# EasyEDA Pro project PLOTUS_ESP32S3_revA_project.epro

# Schematic Schematic1
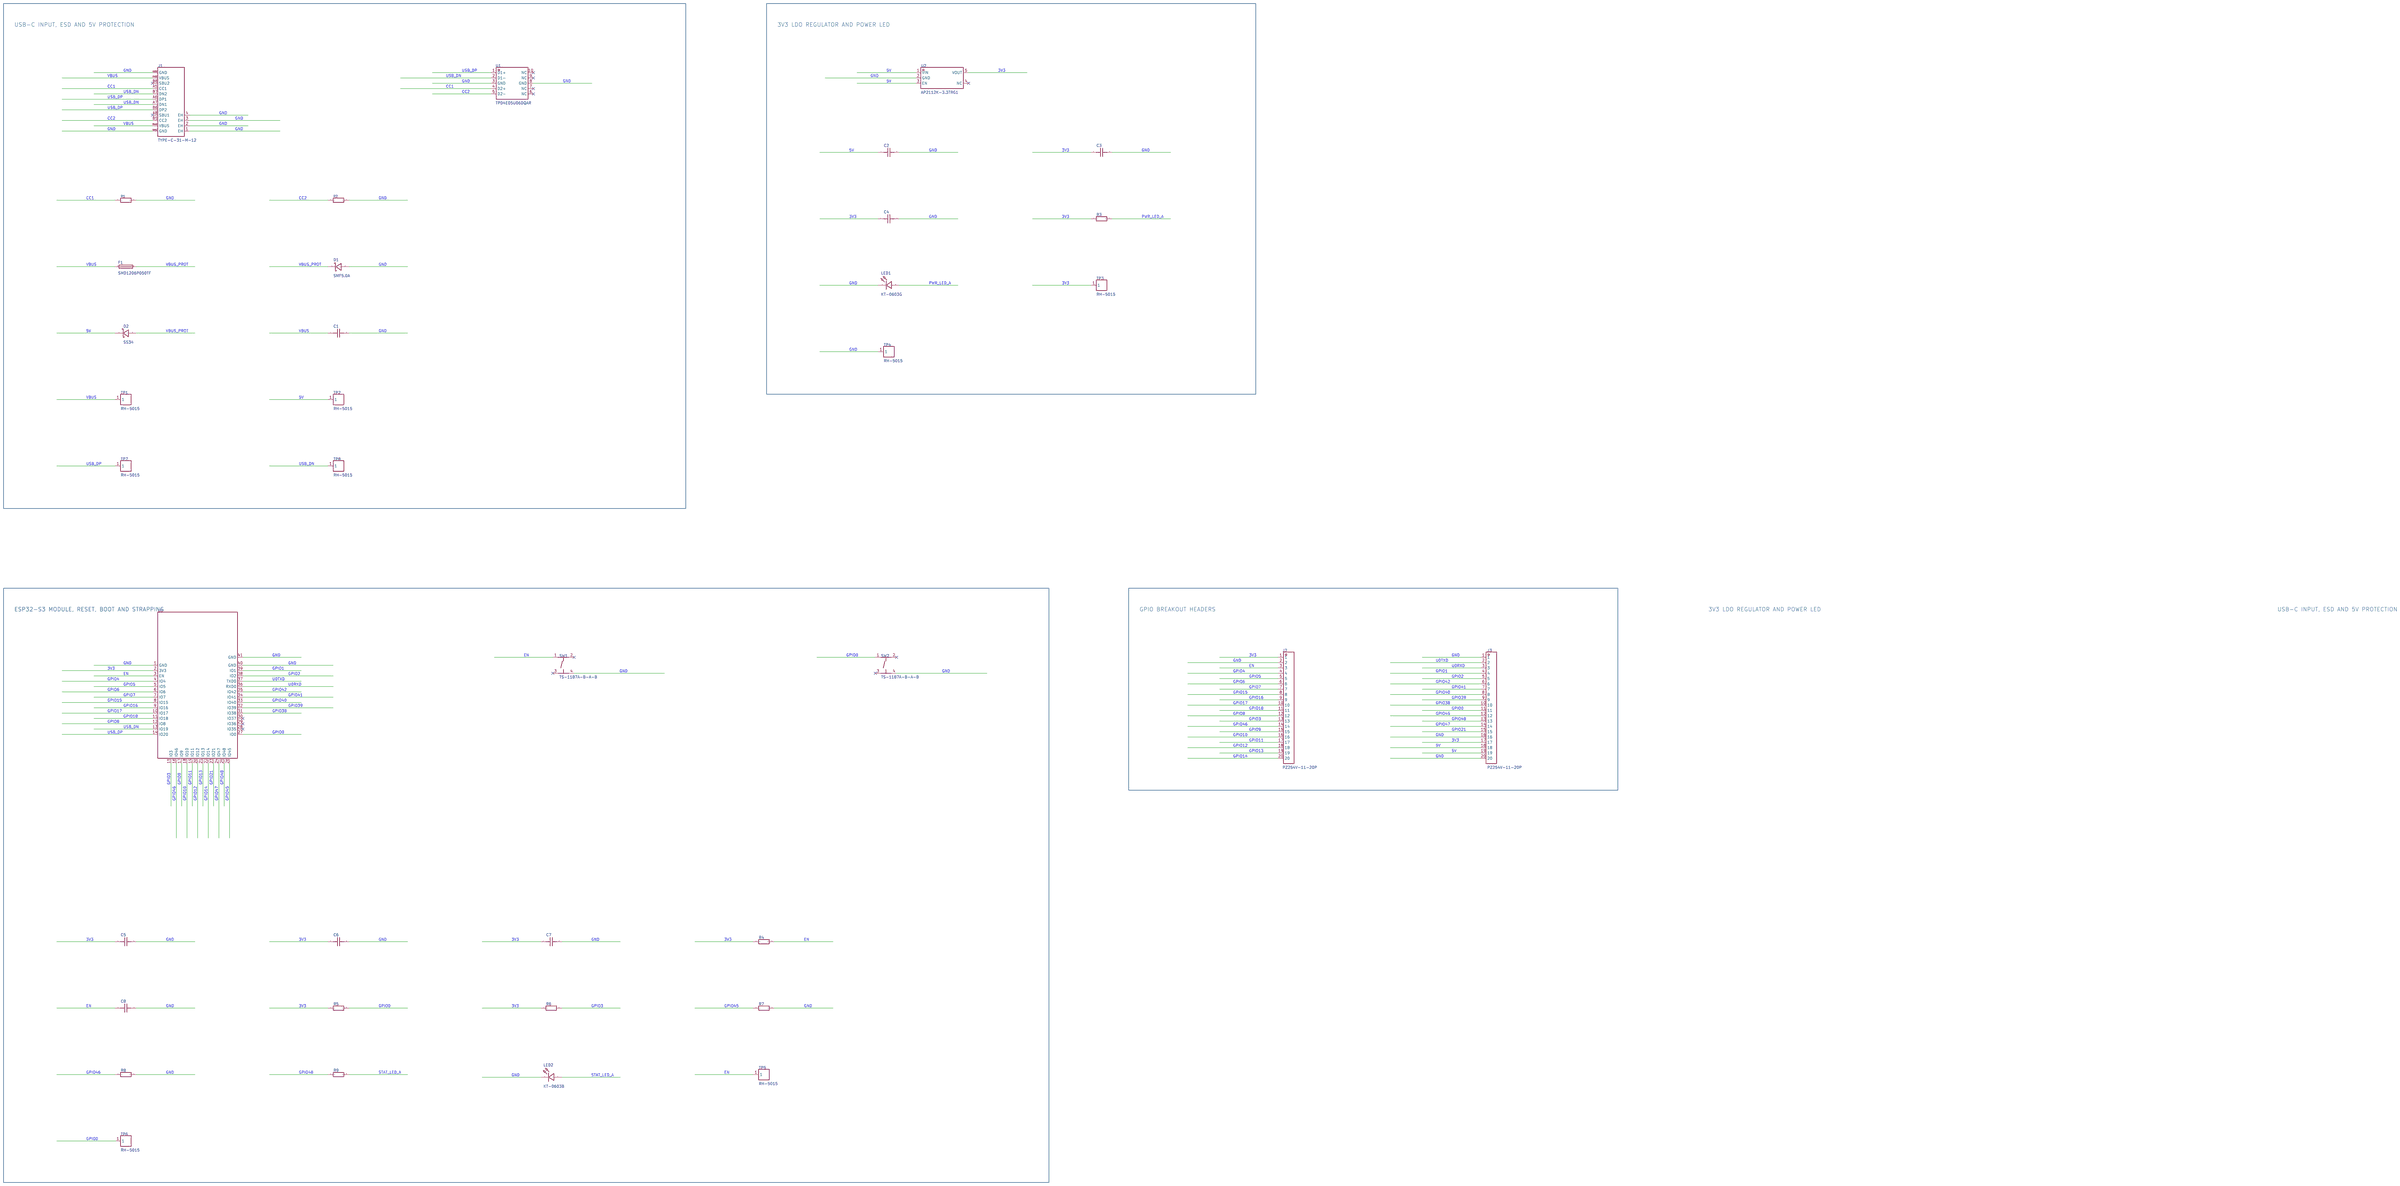
[diagram p0: schematic sheet]

## Parts
C1  100nF  [C0402]
C2  10uF  [C0603]
C3  10uF  [C0603]
C4  100nF  [C0402]
C5  10uF  [C0603]
C6  1uF  [C0402]
C7  100nF  [C0402]
C8  1uF  [C0402]
D1  SMF5.0A  [SOD-123_L2.8-W1.8-LS3.7-RD]
D2  SS34  [SMA_L4.3-W2.6-LS5.2-RD]
F1  SMD1206P050TF  [F1206]
J1  TYPE-C-31-M-12  [USB-C_SMD-TYPE-C-31-M-12_1]
J2  PZ254V-11-20P  [HDR-TH_20P-P2.54-V-M-4]
J3  PZ254V-11-20P  [HDR-TH_20P-P2.54-V-M-4]
LED1  KT-0603G  [LED0603-RD]
LED2  KT-0603B  [LED0603-RD]
R1  5.1kΩ  [R0402]
R2  5.1kΩ  [R0402]
R3  1kΩ  [R0402]
R4  10kΩ  [R0402]
R5  10kΩ  [R0402]
R6  10kΩ  [R0402]
R7  10kΩ  [R0402]
R8  10kΩ  [R0402]
R9  1kΩ  [R0402]
SW1  TS-1187A-B-A-B  [SW-SMD_4P-L5.1-W5.1-P3.70-LS6.5-TL_H1.5]
SW2  TS-1187A-B-A-B  [SW-SMD_4P-L5.1-W5.1-P3.70-LS6.5-TL_H1.5]
TP1  RH-5015  [SMD_RH-5015]
TP2  RH-5015  [SMD_RH-5015]
TP3  RH-5015  [SMD_RH-5015]
TP4  RH-5015  [SMD_RH-5015]
TP5  RH-5015  [SMD_RH-5015]
TP6  RH-5015  [SMD_RH-5015]
TP7  RH-5015  [SMD_RH-5015]
TP8  RH-5015  [SMD_RH-5015]
U1  TPD4E05U06DQAR  [USON-10_L2.5-W1.0-P0.50-BL]
U2  AP2112K-3.3TRG1  [SOT-25-5_L2.9-W1.6-P0.95-LS2.8-BL]
U3  2.4GHz  [WIRELM-SMD_ESP32-S3-WROOM-1]

## Library data of the parts
C1 C4 C7 = CL05B104KO5NNNC: Capacitance:100nF Tolerance:±10% Tolerance:±10% Voltage Rating:16V Temperature Coefficient:X7R; LCSC Part Name: 100nF ±10% 16V; Supplier Part: CL05B104KO5NNNC.1; Manufacturer: SAMSUNG(三星); Supplier Footprint: 0402; JLCPCB Part Class: Basic Part; Datasheet: https://item.szlcsc.com/datasheet/CL05B104KO5NNNC/1877.html; Supplier: LCSC; Tolerance: ±10%; Voltage Rating: 16V; Temperature Coefficient: X7R
C2 C3 C5 = CL10A106KP8NNNC: Capacitance:10uF Tolerance:±10% Tolerance:±10% Voltage Rating:10V Temperature Coefficient:X5R; LCSC Part Name: 10uF ±10% 10V; Supplier Part: CL10A106KP8NNNC.1; Manufacturer: SAMSUNG(三星); Supplier Footprint: 0603; JLCPCB Part Class: Basic Part; Datasheet: https://item.szlcsc.com/datasheet/CL10A106KP8NNNC/20411.html; Supplier: LCSC; Tolerance: ±10%; Voltage Rating: 10V; Temperature Coefficient: X5R
C6 C8 = CL05A105KA5NQNC: Capacitance:1uF Tolerance:±10% Tolerance:±10% Voltage Rating:25V Temperature Coefficient:X5R; LCSC Part Name: 1uF ±10% 25V; Supplier Part: CL05A105KA5NQNC.1; Manufacturer: SAMSUNG(三星); Supplier Footprint: 0402; JLCPCB Part Class: Basic Part; Datasheet: https://item.szlcsc.com/datasheet/CL05A105KA5NQNC/53938.html; Supplier: LCSC; Tolerance: ±10%; Voltage Rating: 25V; Temperature Coefficient: X5R
D1 = SMF5.0A: Reverse Stand-Off Voltage (Vrwm):5V Maximum Clamping Voltage:9.2V Peak Pulse Current (Ipp)@10/1000us:21.7A Breakdown Voltage:6.4V Type:TVS; Supplier Part: SMF5.0A.1; Supplier Footprint: SOD-123; JLCPCB Part Class: Extended Part; Datasheet: https://atta.szlcsc.com/upload/public/pdf/source/20180528/C132591_2E6627FA8E0A601785D44BCCBB8E552F.pdf; Supplier: LCSC; Reverse Stand-Off Voltage (Vrwm): 5V; Maximum Clamping Voltage: 9.2V; Peak Pulse Current (Ipp)@10/1000us: 21.7A; Breakdown Voltage: 6.4V; Type: TVS
D2 = SS34_C8678: Diode Configuration:Standalone Voltage - Forward(Vf@If):550mV@3A Voltage - DC Reverse(Vr):40V Current - Rectified:3A Reverse Leakage Current (Ir):500uA@40V Operating Junction Temperature Range:-55℃~+125℃ Operating Junction Temperature Range:-55℃~+125℃ Non; LCSC Part Name: 电压:40V 电流:3A; Supplier Part: SS34_C8678.1; Manufacturer: MDD(辰达半导体); Supplier Footprint: SMA(DO-214AC); JLCPCB Part Class: Basic Part; Datasheet: https://item.szlcsc.com/datasheet/SS34/9178.html; Supplier: LCSC; Diode Configuration: Standalone; Voltage - Forward(Vf@If): 550mV@3A; Voltage - DC Reverse(Vr): 40V; Current - Rectified: 3A; Reverse Leakage Current (Ir): 500uA@40V; Operating Junction Temperature Range: -55℃~+125℃; Non-Repetitive Peak Forward Surge Current: 80A
F1 = SMD1206P050TF: Operating Voltage (Max):6V Current Rating (Max):100A Hold Current:500mA Trip Current:1A; LCSC Part Name: 6V 500mA 1206自恢复; Supplier Part: SMD1206P050TF_C146251.1; Supplier Footprint: 1206; JLCPCB Part Class: Extended Part; Datasheet: https://atta.szlcsc.com/upload/public/pdf/source/20190516/C393936_420B0FABA34AF599CC1FFF27153B6079.pdf; Supplier: LCSC; Operating Voltage (Max): 6V; Current Rating (Max): 100A; Hold Current: 500mA; Trip Current: 1A
J1 = TYPE-C-31-M-12: Connector Type:Type-C Protocol Standard:- Gender:Female Mounting Type:Surface Mount, Right Angle Number of Contacts:16P Number of Ports:1 Current Rating-Power:5A Voltage Rating:20V Connect-Disconnect Life:10,000 cycles Length:7.35mm Operating Temperature:; LCSC Part Name: Type-C 母 卧贴; Supplier Part: TYPE-C-31-M-12.1; Manufacturer: 韩国韩荣; Supplier Footprint: SMD; JLCPCB Part Class: Extended Part; Datasheet: https://item.szlcsc.com/datasheet/TYPE-C-31-M-12/177331.html; Supplier: LCSC; Connector Type: Type-C; Gender: Female; Mounting Type: Surface Mount, Right Angle; Number of Contacts: 16P; Number of Ports: 1; Current Rating-Power: 5A; Voltage Rating: 20V; Connect-Disconnect Life: 10,000 cycles; Length: 7.35mm; Operating Temperature: -30℃~+80℃
J2 J3 = PZ254V-11-20P: Pin Structure:1x20P Pitch:2.54mm Circluar Pins/Square Pins:Pin Header Mounting Type:Through Hole Number of Rows:1 Number of Pins:20P Current Rating:3A Length of Mating Pin:6.1mm Insulation Height:2.5mm Length of End Connection Pin:3mm Contact Material:Bra; LCSC Part Name: 1x20P 间距:2.54mm 方针 直插; Supplier Part: PZ254V-11-20P.1; Manufacturer: XFCN(兴飞); Supplier Footprint: 插件,P=2.54mm; JLCPCB Part Class: Extended Part; Datasheet: https://item.szlcsc.com/datasheet/PZ254V-11-20P/24163072.html; Supplier: LCSC; Pin Structure: 1x20P; Pitch: 2.54mm; Circluar Pins/Square Pins: Pin Header; Mounting Type: Through Hole; Number of Rows: 1; Number of Pins: 20P; Current Rating: 3A; Length of Mating Pin: 6.1mm; Insulation Height: 2.5mm; Length of End Connection Pin: 3mm; Contact Material: Brass; Operating Temperature: -40℃~+105℃; Color: Black
LED1 = KT-0603G: Lamp Holder Type:1.6mm x 0.8mm square LED Illumination Color:Emerald Green Voltage - Forward(Vf):3.1V Voltage - Forward(Vf):3.1V Power(Watts):100mW Forward Current:5mA Wavelength - Dominant:513nm~528nm Wavelength - Dominant:513nm~528nm Peak Wavelength:525; LCSC Part Name: 0603 翠绿 高亮; Supplier Part: 0603 Green 509-620mcd.1; Manufacturer: KENTO; Supplier Footprint: 0603; JLCPCB Part Class: Extended Part; Datasheet: https://item.szlcsc.com/datasheet/KT-0603G/13258.html; Supplier: LCSC; Lamp Holder Type: 1.6mm x 0.8mm square LED; Illumination Color: Emerald Green; Voltage - Forward(Vf): 3.1V; Power(Watts): 100mW; Forward Current: 5mA; Wavelength - Dominant: 513nm~528nm; Peak Wavelength: 525nm; Diode Configuration: Discrete Diode; Lens Color: Water Clear; Luminous Intensity: 430mcd; Viewing Angle: 120°; Operating Temperature: -40℃~+85℃
LED2 = KT-0603B: Lamp Holder Type:1.6mm x 0.8mm square LED Illumination Color:Blue Voltage - Forward(Vf):3.1V Voltage - Forward(Vf):3.1V Power(Watts):100mW Forward Current:5mA Wavelength - Dominant:460nm~475nm Wavelength - Dominant:460nm~475nm Peak Wavelength:469nm Peak W; LCSC Part Name: 0603 蓝灯 高亮; Supplier Part: Blue light 0603.1; Manufacturer: KENTO; Supplier Footprint: 0603; JLCPCB Part Class: Extended Part; Datasheet: https://item.szlcsc.com/datasheet/KT-0603B/2661.html; Supplier: LCSC; Lamp Holder Type: 1.6mm x 0.8mm square LED; Illumination Color: Blue; Voltage - Forward(Vf): 3.1V; Power(Watts): 100mW; Forward Current: 5mA; Wavelength - Dominant: 460nm~475nm; Peak Wavelength: 469nm; Diode Configuration: Discrete Diode; Lens Color: Water Clear; Luminous Intensity: 175mcd; Viewing Angle: 120°; Operating Temperature: -40℃~+85℃
R1 R2 = 0402WGF5101TCE: Type:Thick Film Resistor Resistance:5.1kΩ Tolerance:±1% Tolerance:±1% Power(Watts):62.5mW Voltage-Supply(Max):50V Temperature Coefficient:±100ppm/℃ Temperature Coefficient:±100ppm/℃ Operating Temperature:-55℃~+155℃ Operating Temperature:-55℃~+155℃; LCSC Part Name: 厚膜电阻 5.1kΩ ±1%; Supplier Part: 0402WGF5101TCE.1; Manufacturer: UNI-ROYAL(厚声); Supplier Footprint: 0402; JLCPCB Part Class: Basic Part; Datasheet: https://item.szlcsc.com/datasheet/0402WGF5101TCE/26648.html; Supplier: LCSC; Type: Thick Film Resistor; Tolerance: ±1%; Power(Watts): 62.5mW; Voltage-Supply(Max): 50V; Temperature Coefficient: ±100ppm/℃; Operating Temperature: -55℃~+155℃
R3 R9 = 0402WGF1001TCE: Type:Thick Film Resistor Resistance:1kΩ Tolerance:±1% Tolerance:±1% Power(Watts):62.5mW Voltage-Supply(Max):50V Temperature Coefficient:±100ppm/℃ Temperature Coefficient:±100ppm/℃ Operating Temperature:-55℃~+155℃ Operating Temperature:-55℃~+155℃; LCSC Part Name: 厚膜电阻 1kΩ ±1%; Supplier Part: 0402WGF1001TCE.1; Manufacturer: UNI-ROYAL(厚声); Supplier Footprint: 0402; JLCPCB Part Class: Basic Part; Datasheet: https://item.szlcsc.com/datasheet/0402WGF1001TCE/12256.html; Supplier: LCSC; Type: Thick Film Resistor; Tolerance: ±1%; Power(Watts): 62.5mW; Voltage-Supply(Max): 50V; Temperature Coefficient: ±100ppm/℃; Operating Temperature: -55℃~+155℃
R4-R8 = 0402WGF1002TCE: Type:Thick Film Resistor Resistance:10kΩ Tolerance:±1% Tolerance:±1% Power(Watts):62.5mW Voltage-Supply(Max):50V Temperature Coefficient:±100ppm/℃ Temperature Coefficient:±100ppm/℃ Operating Temperature:-55℃~+155℃ Operating Temperature:-55℃~+155℃; LCSC Part Name: 厚膜电阻 10kΩ ±1%; Supplier Part: 0402WGF1002TCE.1; Manufacturer: UNI-ROYAL(厚声); Supplier Footprint: 0402; JLCPCB Part Class: Basic Part; Datasheet: https://item.szlcsc.com/datasheet/0402WGF1002TCE/26487.html; Supplier: LCSC; Type: Thick Film Resistor; Tolerance: ±1%; Power(Watts): 62.5mW; Voltage-Supply(Max): 50V; Temperature Coefficient: ±100ppm/℃; Operating Temperature: -55℃~+155℃
SW1 SW2 = TS-1187A-B-A-B: Circuit:SPST Actuator Style:Round Button Operating Force:1.6N Mounting Type:Surface Mount,Vertical Length:5.1mm Width:5.1mm Switch Height:1.5mm with Bracket:Without Bracket Contact Current:50mA Voltage Rating:12V Actuator/Cap Color:Gold With Lamp:No Life:; LCSC Part Name: 5.1*5.1*1.5mm 立贴 轻触开关; Supplier Part: TS-1187A-B-A-B.1; Manufacturer: XKB Connection(中国星坤); Supplier Footprint: SMD-4P,5.1x5.1mm; JLCPCB Part Class: Basic Part; Datasheet: https://item.szlcsc.com/datasheet/TS-1187A-B-A-B/299976.html; Supplier: LCSC; Circuit: SPST; Actuator Style: Round Button; Operating Force: 1.6N; Mounting Type: Surface Mount,Vertical; Length: 5.1mm; Width: 5.1mm; Switch Height: 1.5mm; with Bracket: Without Bracket; Contact Current: 50mA; Voltage Rating: 12V; Actuator/Cap Color: Gold; With Lamp: No; Life: 100,000 cycles; Operating Temperature: -30℃~+85℃
TP1-TP8 = RH-5015: Connector Type:Ferrite Ring (SMD) Plastic Color:Non-Plastic Board Space (Diameter φ/ Length x Width):2.67mmx1.02mm; LCSC Part Name: PCB电路板测试点/测试针; Supplier Part: RH-5015.1; Manufacturer: 荣和; JLCPCB Part Class: Extended Part; Datasheet: https://item.szlcsc.com/datasheet/RH-5015/5885634.html; Supplier: LCSC; Connector Type: Ferrite Ring (SMD); Plastic Color: Non-Plastic; Board Space (Diameter φ/ Length x Width): 2.67mmx1.02mm
U1 = TPD4E05U06DQAR: Supplier Part: TPD4E05U06DQAR.1; Supplier Footprint: USON-10; JLCPCB Part Class: Extended Part; Supplier: LCSC
U2 = AP2112K-3.3TRG1: Output Configuration:Positive Voltage - Supply:6V Output Voltage:3.3V Output Voltage:3.3V Output Current:600mA Power Supply Rejection Ratio (PSRR):65dB@(1kHz) Voltage Dropout:250mV@(600mA) standby current:55uA Noise:50uVrms Features:Enable control；Short C; LCSC Part Name: 3.3V 600mA 6V; Supplier Part: AP2112K-3.3TRG1.1; Manufacturer: DIODES(美台); Supplier Footprint: SOT-25-5; JLCPCB Part Class: Extended Part; Datasheet: https://item.szlcsc.com/datasheet/AP2112K-3.3TRG1/52131.html; Supplier: LCSC; Output Configuration: Positive; Voltage - Supply: 6V; Output Voltage: 3.3V; Output Current: 600mA; Power Supply Rejection Ratio (PSRR): 65dB@(1kHz); Voltage Dropout: 250mV@(600mA); standby current: 55uA; Noise: 50uVrms; Features: Enable control；Short Circuit Protection；Output discharge；Over Current Protection；Thermal shutdown; Operating Temperature: -40℃~+85℃@(Ta); Output Type: Fixed; Number of Outputs: 1
U3 = ESP32-S3-WROOM-1-N16R8: Utilized IC / Part:ESP32-S3R8 Interface Type:I2C；GPIO；UART；SPI；USB；I2S Frequency:2.4GHz Antenna Type:On-board PCB Antenna Output Power:20.5dBm Output Power:20.5dBm Voltage - Supply:3V~3.6V Voltage - Supply:3V~3.6V Receive  Current:95mA Send  Current:355mA; LCSC Part Name: 不带固件 通用型Wi-Fi+低功耗蓝牙MCU模组; Supplier Part: ESP32-S3-WROOM-1(N16R8).1; Manufacturer: ESPRESSIF(乐鑫); Supplier Footprint: SMD,25.5x18mm; JLCPCB Part Class: Extended Part; Datasheet: https://item.szlcsc.com/datasheet/ESP32-S3-WROOM-1-N16R8/3198300.html; Supplier: LCSC; Utilized IC / Part: ESP32-S3R8; Interface Type: I2C；GPIO；UART；SPI；USB；I2S; Antenna Type: On-board PCB Antenna; Output Power: 20.5dBm; Voltage - Supply: 3V~3.6V; Receive  Current: 95mA; Send  Current: 355mA; Sensitivity: -103.5dBm; Operating Temperature: -40℃~+65℃

## Nets
3V3: C3.1 C4.1 C5.1 C6.1 C7.1 J2.1 J3.17 R3.1 R4.1 R5.1 R6.1 TP3.1 U2.5(VOUT) U3.2(3V3)
5V: C2.1 D2.1(K) J3.18 J3.19 TP2.1 U2.1(VIN) U2.3(EN)
GND: C1.2 C2.2 C3.2 C4.2 C5.2 C6.2 C7.2 C8.2 D1.2(A) J1.1(EH) J1.2(EH) J1.3(EH) J1.4(EH) J1.A1B12(GND) J1.B1A12(GND) J2.2 J3.1 J3.16 J3.20 LED1.1(K) LED2.1(K) R1.2 R2.2 R7.2 R8.2 SW1.4(D) SW2.4(D) TP4.1 U1.3(GND) U1.8(GND) U2.2(GND) U3.1(GND) U3.40(GND) U3.41(GND)
VBUS: C1.1 F1.1 J1.A4B9(VBUS) J1.B4A9(VBUS) TP1.1
VBUS_PROT: D1.1(K) D2.2(A) F1.2
CC1: J1.A5(CC1) R1.1 U1.4(D2+)
CC2: J1.B5(CC2) R2.1 U1.5(D2-)
EN: C8.1 J2.3 R4.2 SW1.1(A) TP5.1 U3.3(EN)
GPIO0: J3.11 R5.2 SW2.1(A) TP6.1 U3.27(IO0)
GPIO1: J3.4 U3.39(IO1)
GPIO2: J3.5 U3.38(IO2)
GPIO3: J2.13 R6.2 U3.15(IO3)
GPIO4: J2.4 U3.4(IO4)
GPIO5: J2.5 U3.5(IO5)
GPIO6: J2.6 U3.6(IO6)
GPIO7: J2.7 U3.7(IO7)
GPIO8: J2.12 U3.12(IO8)
GPIO9: J2.15 U3.17(IO9)
GPIO10: J2.16 U3.18(IO10)
GPIO11: J2.17 U3.19(IO11)
GPIO12: J2.18 U3.20(IO12)
GPIO13: J2.19 U3.21(IO13)
GPIO14: J2.20 U3.22(IO14)
GPIO15: J2.8 U3.8(IO15)
GPIO16: J2.9 U3.9(IO16)
GPIO17: J2.10 U3.10(IO17)
GPIO18: J2.11 U3.11(IO18)
GPIO21: J3.15 U3.23(IO21)
GPIO38: J3.10 U3.31(IO38)
GPIO39: J3.9 U3.32(IO39)
GPIO40: J3.8 U3.33(IO40)
GPIO41: J3.7 U3.34(IO41)
GPIO42: J3.6 U3.35(IO42)
GPIO45: J3.12 R7.1 U3.26(IO45)
GPIO46: J2.14 R8.1 U3.16(IO46)
GPIO47: J3.14 U3.24(IO47)
GPIO48: J3.13 R9.1 U3.25(IO48)
PWR_LED_A: LED1.2(A) R3.2
STAT_LED_A: LED2.2(A) R9.2
U0RXD: J3.3 U3.36(RXD0)
U0TXD: J3.2 U3.37(TXD0)
USB_DN: J1.A7(DN1) J1.B7(DN2) TP8.1 U1.2(D1-) U3.13(IO19)
USB_DP: J1.A6(DP1) J1.B6(DP2) TP7.1 U1.1(D1+) U3.14(IO20)

Not connected (* = marked no-connect by the designer): J1 A8(SBU1)* B8(SBU2)*; SW1 2(B)* 3(C)*; SW2 2(B)* 3(C)*; U1 6(NC)* 7(NC)* 9(NC)* 10(NC)*; U2 4(NC)*; U3 28(IO35)* 29(IO36)* 30(IO37)*

## Notes on the sheet
- USB-C INPUT, ESD AND 5V PROTECTION
- 3V3 LDO REGULATOR AND POWER LED
- ESP32-S3 MODULE, RESET, BOOT AND STRAPPING
- ESP32-S3 MODULE, RESET, BOOT AND STRAPPING
- GPIO BREAKOUT HEADERS
- 3V3 LDO REGULATOR AND POWER LED
- USB-C INPUT, ESD AND 5V PROTECTION

# Board PCB1
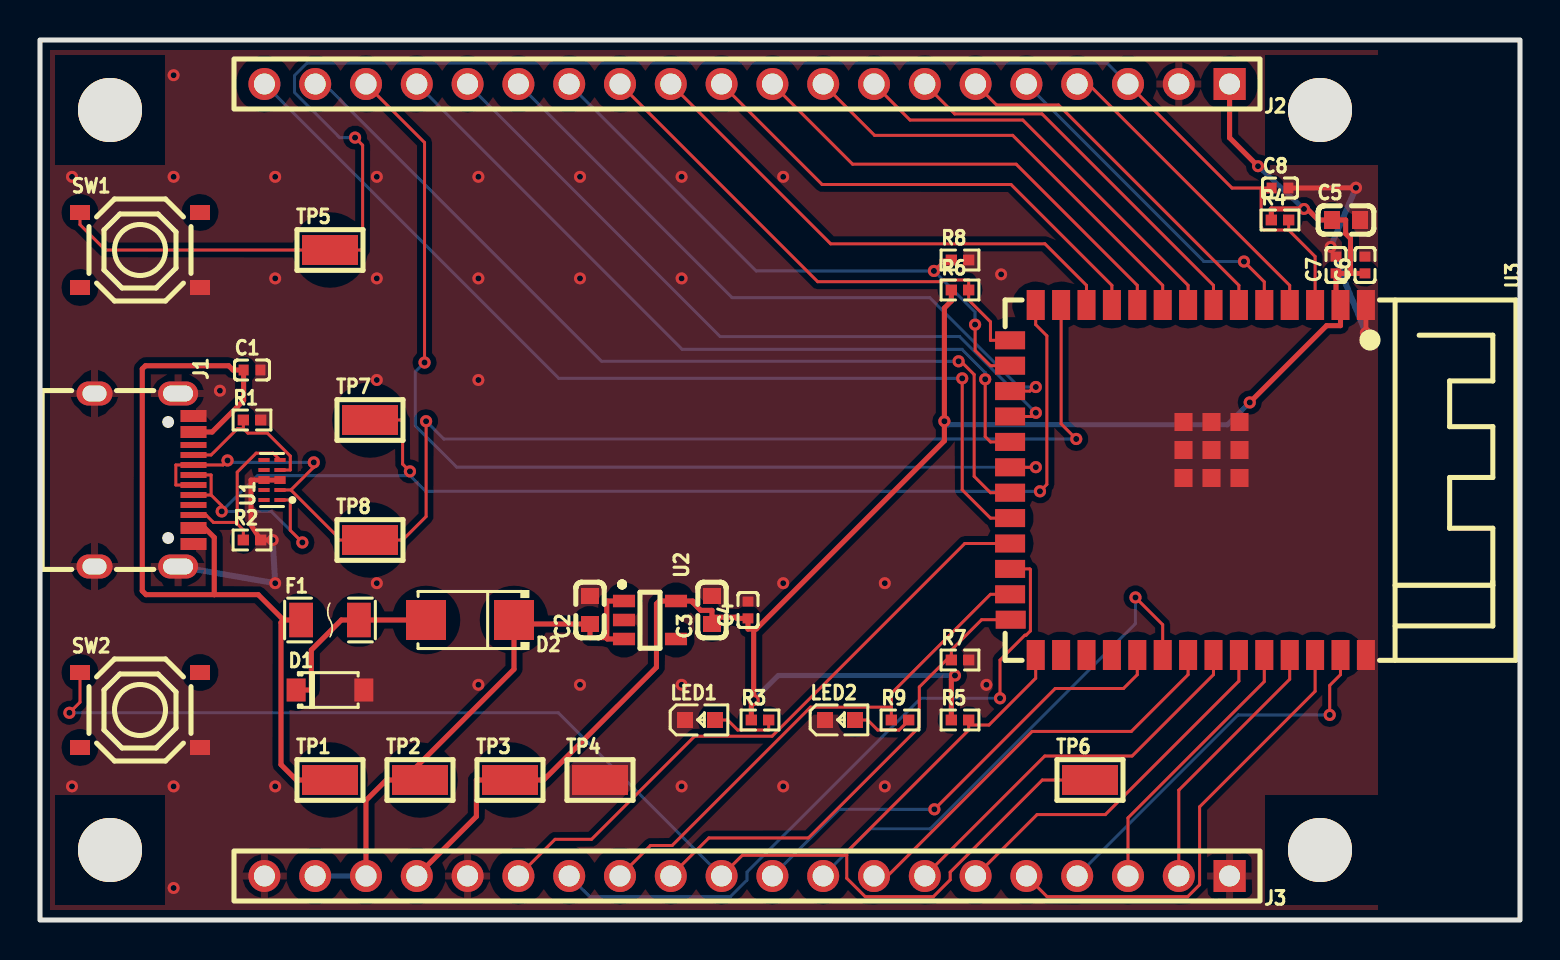
[diagram p1: board, top side]
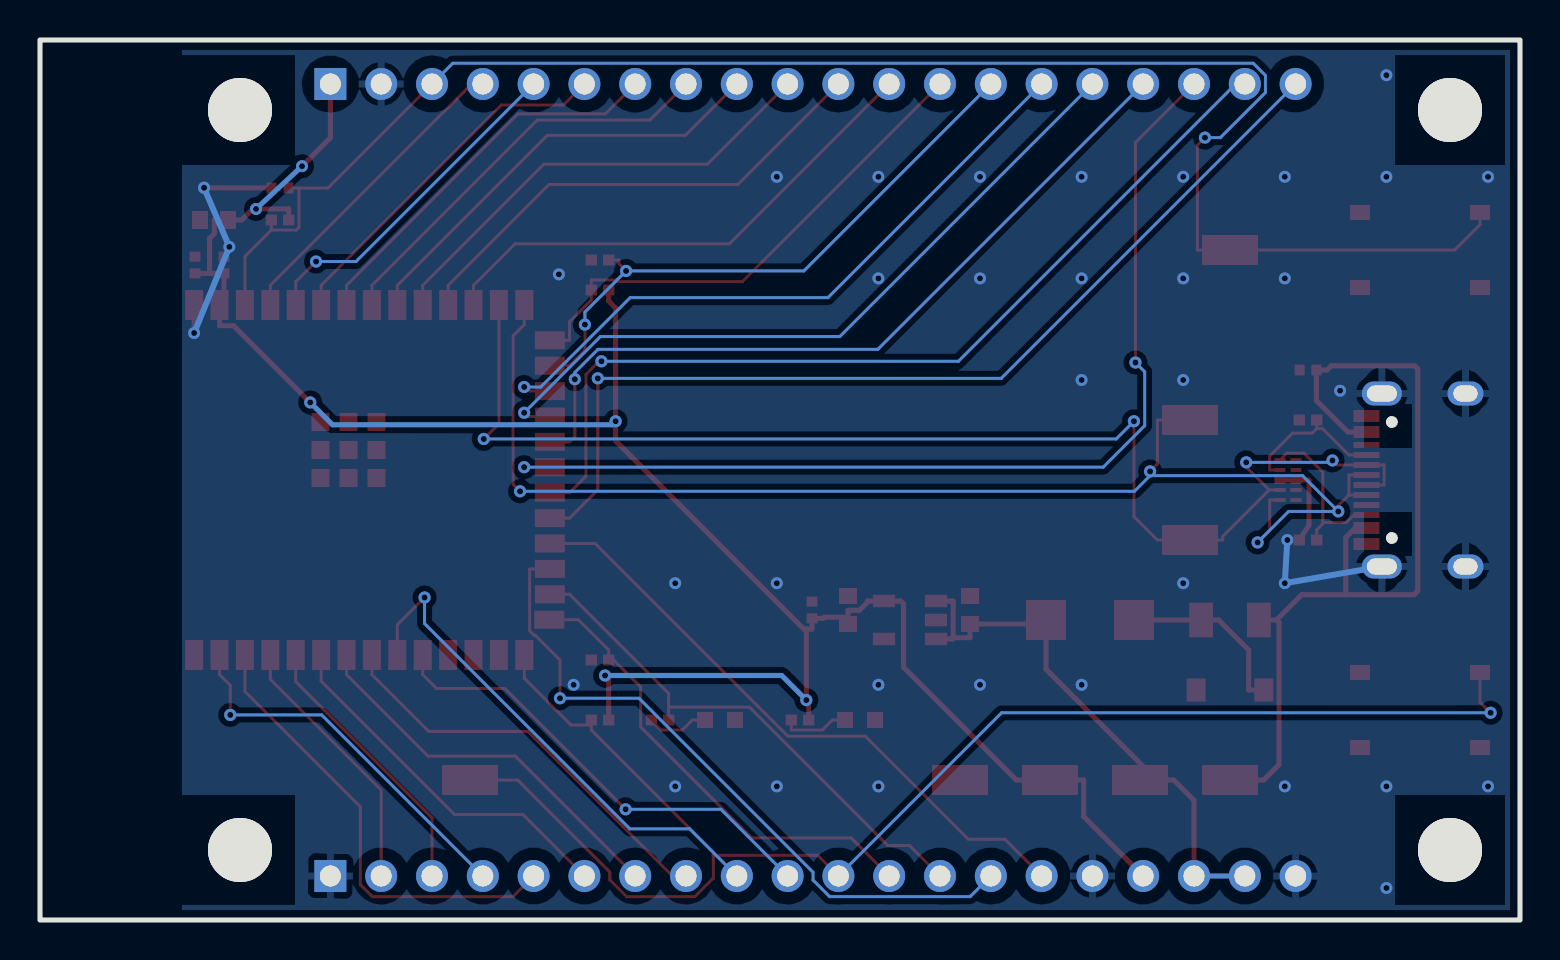
[diagram p2: board, bottom side, seen from below]

Outline 74 x 44 mm; copper layers: Top Layer, Bottom Layer. Coordinates in mm from the lower left corner of the outline.
Outline path: rectangle 0,44 74,0
Stack: Top Layer 0.035mm / Dielectric1 1.51mm FR4 er 4.5 / Bottom Layer 0.035mm

## Design rules (mm)
spacing copperThickness1oz (default): track to track 0.102, other pairs 0.152 to 0.3
spacing copperThickness2oz: track to track 0.203, other pairs 0.152 to 0.3
track width copperThickness1oz (default): min 0.15, default 0.15, max 2.54
track width copperThickness2oz: min 0.203, default 0.254, max 2.54
differential pair differentialPair (default): width min 0.127, default 0.254, max 2.54; gap min 0.152, default 0.152

## Placement (name value [footprint] x y rotation side)
C1  100nF  [C0402]  10.6 27.5 0 top
C2  10uF  [C0603]  27.5 15.5 90 top
C3  10uF  [C0603]  33.6 15.5 90 top
C4  100nF  [C0402]  35.4 15.5 90 top
C5  10uF  [C0603]  65.3 35 0 top
C6  1uF  [C0402]  66.25 32.75 90 top
C7  100nF  [C0402]  64.8 32.75 90 top
C8  1uF  [C0402]  62 36.6 0 top
D1  SMF5.0A  [SOD-123_L2.8-W1.8-LS3.7-RD]  14.5 11.5 0 top
D2  SS34  [SMA_L4.3-W2.6-LS5.2-RD]  21.5 15 180 top
F1  SMD1206P050TF  [F1206]  14.5 15 0 top
J1  TYPE-C-31-M-12  [USB-C_SMD-TYPE-C-31-M-12_1]  5.2 22 270 top
J2  PZ254V-11-20P  [HDR-TH_20P-P2.54-V-M-4]  35.35 41.8 180 top
J3  PZ254V-11-20P  [HDR-TH_20P-P2.54-V-M-4]  35.35 2.2 180 top
LED1  KT-0603G  [LED0603-RD]  33 10 0 top
LED2  KT-0603B  [LED0603-RD]  40 10 0 top
NOREF  -  [Pad_e162]  64 40.5 0 top
NOREF#2  -  [Pad_e161]  64 3.5 0 top
NOREF#3  -  [Pad_e160]  3.5 40.5 0 top
NOREF#4  -  [Pad_e159]  3.5 3.5 0 top
R1  5.1kΩ  [R0402]  10.6 25 0 top
R2  5.1kΩ  [R0402]  10.6 19 0 top
R3  1kΩ  [R0402]  36 10 0 top
R4  10kΩ  [R0402]  62 35 0 top
R5  10kΩ  [R0402]  46 10 0 top
R6  10kΩ  [R0402]  46 31.5 0 top
R7  10kΩ  [R0402]  46 13 0 top
R8  10kΩ  [R0402]  46 33 0 top
R9  1kΩ  [R0402]  43 10 0 top
SW1  TS-1187A-B-A-B  [SW-SMD_4P-L5.1-W5.1-P3.70-LS6.5-TL_H1.5]  5 33.5 0 top
SW2  TS-1187A-B-A-B  [SW-SMD_4P-L5.1-W5.1-P3.70-LS6.5-TL_H1.5]  5 10.5 0 top
TP1  RH-5015  [SMD_RH-5015]  14.5 7 0 top
TP2  RH-5015  [SMD_RH-5015]  19 7 0 top
TP3  RH-5015  [SMD_RH-5015]  23.5 7 0 top
TP4  RH-5015  [SMD_RH-5015]  28 7 0 top
TP5  RH-5015  [SMD_RH-5015]  14.5 33.5 0 top
TP6  RH-5015  [SMD_RH-5015]  52.5 7 0 top
TP7  RH-5015  [SMD_RH-5015]  16.5 25 0 top
TP8  RH-5015  [SMD_RH-5015]  16.5 19 0 top
U1  TPD4E05U06DQAR  [USON-10_L2.5-W1.0-P0.50-BL]  11.6 22 90 top
U2  AP2112K-3.3TRG1  [SOT-25-5_L2.9-W1.6-P0.95-LS2.8-BL]  30.5 15 270 top
U3  2.4GHz  [WIRELM-SMD_ESP32-S3-WROOM-1]  57.4 22 270 top

## Footprints (pads in the part's own frame, mm; a bottom-side part is the same pattern mirrored in y, then rotated)
C0402
  rect 0.5x0.54 smd: 1(-0.42,0) 2(0.42,0)
C0603
  rect 0.8x0.9 smd: 1(-0.7,0) 2(0.7,0)
F1206
  rect 1.19x1.728 smd: 1(-1.445,0) 2(1.445,0)
HDR-TH_20P-P2.54-V-M-4
  rect 1.6x1.6 hole 1.05: 1(-24.13,0)
  round 1.6 hole 1.05: 2(-21.59,0) 3(-19.05,0) 4(-16.51,0) 5(-13.97,0) 6(-11.43,0) 7(-8.89,0) 8(-6.35,0) 9(-3.81,0) 10(-1.27,0) 11(1.27,0) 12(3.81,0) 13(6.35,0) 14(8.89,0) 15(11.43,0) 16(13.97,0) 17(16.51,0) 18(19.05,0) 19(21.59,0) 20(24.13,0)
LED0603-RD
  rect 0.8x0.8 smd: 1(-0.749,0) 2(0.749,0)
Pad_e159
  round 3.2 hole 3.2: MH1(0,0)
Pad_e160
  round 3.2 hole 3.2: MH2(0,0)
Pad_e161
  round 3.2 hole 3.2: MH3(0,0)
Pad_e162
  round 3.2 hole 3.2: MH4(0,0)
R0402
  rect 0.566x0.54 smd: 1(-0.433,0) 2(0.433,0)
SMA_L4.3-W2.6-LS5.2-RD
  rect 2x2 smd: 1(-2.2,0) 2(2.2,0)
SMD_RH-5015
  rect 2.8x1.5 smd: 1(0,0)
SOD-123_L2.8-W1.8-LS3.7-RD
  rect 0.95x1.15 smd: 1(-1.692,0) 2(1.692,0)
SOT-25-5_L2.9-W1.6-P0.95-LS2.8-BL
  rect 0.623x1.105 smd: 1(-0.95,-1.3) 2(-0.001,-1.3) 3(0.95,-1.3) 4(0.95,1.3) 5(-0.95,1.3)
SW-SMD_4P-L5.1-W5.1-P3.70-LS6.5-TL_H1.5
  rect 1x0.75 smd: 1(-3,1.875) 2(3,1.875) 3(-3,-1.875) 4(3,-1.875)
USB-C_SMD-TYPE-C-31-M-12_1
  oval 1.2x2 hole 0.8x1.5: 1(4.325,1.706) 4(-4.325,1.706)
  oval 1.2x1.8 hole 0.8x1.2: 2(4.325,-2.474) 3(-4.325,-2.474)
  custom 0.6x1.3 smd: A1B12(-3.2,2.474) A4B9(-2.4,2.474) B1A12(3.2,2.474) B4A9(2.401,2.474)
  rect 0.3x1.3 smd: A5(-1.25,2.474) A6(-0.25,2.474) A7(0.25,2.474) A8(1.25,2.474) B5(1.75,2.474) B6(0.75,2.474) B7(-0.75,2.474) B8(-1.75,2.474)
USON-10_L2.5-W1.0-P0.50-BL
  rect 0.2x0.565 smd: 1(-1,-0.4) 2(-0.5,-0.4) 4(0.5,-0.4) 5(1,-0.4) 6(1,0.4) 7(0.5,0.4) 9(-0.5,0.4) 10(-1,0.4)
  rect 0.4x0.565 smd: 3(0,-0.4) 8(0,0.4)
WIRELM-SMD_ESP32-S3-WROOM-1
  rect 1.5x0.9 smd: 1(-8.75,8.895) 2(-8.75,7.625) 3(-8.75,6.355) 4(-8.75,5.085) 5(-8.75,3.815) 6(-8.75,2.545) 7(-8.75,1.275) 8(-8.75,0.005) 9(-8.75,-1.265) 10(-8.75,-2.535) 11(-8.75,-3.805) 12(-8.75,-5.075) 13(-8.75,-6.345) 14(-8.75,-7.615) 27(8.75,-7.615) 28(8.75,-6.345) 29(8.75,-5.075) 30(8.75,-3.805) 31(8.75,-2.535) 32(8.75,-1.265) 33(8.75,0.005) 34(8.75,1.275) 35(8.75,2.545) 36(8.75,3.815) 37(8.75,5.085) 38(8.75,6.355) 39(8.75,7.625) 40(8.75,8.895)
  rect 0.9x1.5 smd: 15(-6.985,-8.895) 16(-5.715,-8.895) 17(-4.445,-8.895) 18(-3.175,-8.895) 19(-1.905,-8.895) 20(-0.635,-8.895) 21(0.635,-8.895) 22(1.905,-8.895) 23(3.175,-8.895) 24(4.445,-8.895) 25(5.715,-8.895) 26(6.985,-8.865)
  rect 0.9x0.9 smd: 41(-2.9,2.575) 41(-2.9,1.175) 41(-2.9,-0.225) 41(-1.5,2.575) 41(-1.5,1.175) 41(-1.5,-0.225) 41(-0.1,2.575) 41(-0.1,1.175) 41(-0.1,-0.225)

## Nets
As in the schematic.

Pads without a net: J1 A8 B8; NOREF MH4; NOREF#2 MH3; NOREF#3 MH2; NOREF#4 MH1; SW1 2 3; SW2 2 3; U1 6 7 9 10; U2 4; U3 28 29 30

## Via types
v1: diameter 0.6, hole 0.3, Top Layer to Bottom Layer, 38 vias
v2: diameter 0.61, hole 0.305, Top Layer to Bottom Layer, 29 vias

## Routing (per net, layer and track width the routed paths; a pad name or vN(x,y) marks a point on that pad's centre or on a via; arc(x,y) is an arc through that point)
3V3: length 107.2
  Top Layer w0.254: 65.02,30.23 65.02,29.72 64.33,29.72 v2(60.49,25.88) ; 65.02,30.23 64.8,30.46 64.8,32.33 65.52,32.33 ; 65.02,30.23 65.02,30.75 ; 33.6,15.14 34.79,15.14 34.85,15.08 C4.1 35.4,14.55 35.68,14.55 ; 33.6,15.14 33.6,15.48 33.03,15.48 32.63,15.88 32.63,15.95 30.97,15.95 30.82,15.81 30.82,12.64 25.18,7 TP3.1 21.82,7 21.82,5.18 J3.17 ; 33.6,15.14 C3.1 ; 66.25,32.33 65.52,32.33 ; 65.52,32.33 65.52,34.07 65.28,34.32 65.28,35 C5.1 63.92,35 63.37,35.55 61.57,35.55 R4.1 ; v2(45.75,12.22) 45.57,12.04 R5.1 ; 35.68,14.55 v2(35.68,11) 35.57,10.88 R3.1 ; 35.68,14.55 35.81,14.55 45.22,23.96 v2(45.22,24.94) 45.22,30.6 45.57,30.95 R6.1 ; 59.48,39.11 v1(60.9,37.69) ; 59.48,39.11 J2.1
  Bottom Layer w0.254: v2(45.22,24.94) 45.4,24.76 59.37,24.76 v2(60.49,25.88) ; v1(60.9,37.69) v1(63.2,35.55) ; v2(35.68,11) 36.91,12.22 v2(45.75,12.22)
5V: length 28.7
  Top Layer w0.254: 28.34,14.12 28.34,15.92 28.36,15.95 29.2,15.95 ; 28.34,14.12 27.5,14.12 C2.1 23.7,14.8 ; 28.34,14.12 28.36,14.09 28.36,14.05 29.2,14.05 ; 23.7,14.8 23.7,12.54 18.16,7 ; 23.7,14.8 D2.1 ; 18.16,7 TP2.1 ; 18.16,7 17.32,7 16.3,5.98 J3.18
  Bottom Layer w0.254: J3.19 J3.18
GND: length 24.9
  Top Layer w0.25: U1.3 U1.8 10.55,22 10.55,19.75 11.03,19 v1(11.63,19) ; C8.2 65.8,36.61 ; 66.29,30.75 v1(66.29,29.35)
  Bottom Layer w0.3: v1(11.63,19) v1(11.76,16.84) J1.1 ; 65.8,36.61 64.53,33.66 v1(66.29,29.35)
  vias: v1(1.6,37.16) v1(1.6,6.68) v1(6.68,42.24) v1(6.68,37.16) v1(6.68,6.68) v1(6.68,1.6) v1(9,26.47) v1(11.76,37.16) v1(11.76,32.08) v1(11.76,6.68) v1(16.84,37.16) v1(16.84,32.08) v1(16.84,27) v1(16.84,16.84) v1(21.92,37.16) v1(21.92,32.08) v1(21.92,27) v1(21.92,11.76) v1(27,37.16) v1(27,32.08) v1(27,11.76) v1(32.08,37.16) v1(32.08,32.08) v1(32.08,11.76) v1(32.08,6.68) v1(37.16,37.16) v1(37.16,16.84) v1(37.16,6.68) v1(42.24,16.84) v1(42.24,6.68) v1(47.32,11.76) v1(48.06,32.28) v1(64.53,33.66) v2(65.8,36.61)
VBUS: length 43.7
  Top Layer w0.254: 12.18,15 12.05,14.87 12.05,7.77 12.82,7 TP1.1 ; 12.18,15 10.91,16.27 8.71,16.27 ; 12.18,15 F1.1 ; 8.71,16.27 8.71,19.13 8.24,19.6 7.67,19.6 ; 8.71,16.27 5.3,16.27 5.11,16.46 5.11,27.56 5.27,27.71 9.44,27.71 9.65,27.5 C1.1 10.18,25.97 8.61,24.4 J1.A4B9
VBUS_PROT: length 9.1
  Top Layer w0.254: 12.81,11.5 13.57,11.5 13.57,13.5 15.07,15 19.3,15
CC1: length 7.6
  Top Layer w0.15: 10.17,25 10.17,24.57 ; 10.17,24.57 10.39,24.34 11.37,24.34 12.51,23.2 12.51,22.5 U1.4 ; 10.17,24.57 9.88,24.57 8.55,23.25 7.67,23.25
CC2: length 8.5
  Top Layer w0.15: 7.67,20.25 8.3,20.25 8.67,19.88 9.86,19.88 ; 9.86,19.88 9.86,19.81 10.17,19.5 10.17,19 ; 9.86,19.88 9.86,22.39 10.81,23.34 11.66,23.34 U1.5
EN: length 85.7
  Top Layer w0.15: 62.43,34.5 61.18,34.5 61.05,34.63 61.05,36.6 ; 62.43,34.5 R4.2 ; 62.43,34.5 63.75,33.17 63.75,30.75 ; 61.05,36.6 59.6,36.6 J2.3 ; 61.05,36.6 C8.1 ; v2(15.75,39.12) 16.13,38.74 16.13,33.5 TP5.1 3.27,33.5 2,34.77 2,35.37
  Bottom Layer w0.15: v2(15.75,39.12) 14.98,39.12 12.73,41.37 12.73,42.23 13.34,42.84 53.36,42.84 J2.3
GPIO0: length 76
  Top Layer w0.15: J3.11 35.12,3.24 40.34,3.24 ; 46.43,10 46.43,9.75 ; 46.43,9.75 46.43,9.5 40.34,3.4 40.34,3.24 ; 46.43,9.75 47.45,9.75 49.78,12.09 49.78,13.25 ; 40.34,3.24 40.34,2.09 41.26,1.17 44.67,1.17 45.51,2.01 45.51,2.39 50.12,7 TP6.1 ; v2(1.47,10.36) 2,10.89 SW2.1
  Bottom Layer w0.15: v2(1.47,10.36) 25.92,10.36 J3.11
GPIO1: length 19.2
  Top Layer w0.15: v2(64.49,10.25) 64.49,11.73 65.02,12.27 65.02,13.25
  Bottom Layer w0.15: v2(64.49,10.25) 59.91,10.25 J3.4
GPIO2: length 23.2
  Top Layer w0.15: 63.75,13.25 63.75,11.43 57.98,5.66 57.98,1.76 57.39,1.17 50.35,1.17 J3.5
GPIO3: length 26
  Top Layer w0.15: J2.13 38.88,31.92 45.09,31.92 45.18,32 46.43,32 46.43,31 47.52,29.91 47.52,28.98 48.51,28.98
GPIO4: length 15.8
  Top Layer w0.15: J2.4 52.42,41.8 62.48,31.73 62.48,30.75
GPIO5: length 17.2
  Top Layer w0.15: 61.21,30.75 61.21,31.91 v2(60.2,32.92)
  Bottom Layer w0.15: J2.5 58.2,32.92 v2(60.2,32.92)
GPIO6: length 18.3
  Top Layer w0.15: J2.6 47.83,40.75 50.93,40.75 59.94,31.73 59.94,30.75
GPIO7: length 19.6
  Top Layer w0.15: J2.7 45.74,40.3 50.1,40.3 58.67,31.73 58.67,30.75
GPIO8: length 25.9
  Top Layer w0.15: 52.32,30.75 52.32,31.73 50.25,33.81 39.53,33.81 J2.12
GPIO9: length 33.5
  Top Layer w0.15: v2(49.79,26.65) 49.69,26.65 49.49,26.44 48.51,26.44
  Bottom Layer w0.15: v2(49.79,26.65) 48.96,26.65 44.49,31.12 34.6,31.12 J2.15
GPIO10: length 36.6
  Top Layer w0.15: v2(49.79,25.36) 49.6,25.17 48.51,25.17
  Bottom Layer w0.15: v2(49.79,25.36) 45.98,29.17 34.01,29.17 J2.16
GPIO11: length 39
  Top Layer w0.15: v2(47.26,27.04) 47.26,24.17 47.52,23.9 48.51,23.9
  Bottom Layer w0.15: v2(47.26,27.04) 47.26,27.38 46.1,28.53 32.11,28.53 J2.17
GPIO12: length 51.7
  Top Layer w0.15: v2(49.79,22.64) 49.78,22.63 48.51,22.63 ; v2(19.23,27.87) 19.23,38.87 J2.18
  Bottom Layer w0.15: v2(19.23,27.87) 18.77,27.41 18.77,24.71 20.84,22.64 v2(49.79,22.64)
GPIO13: length 46.2
  Top Layer w0.15: 48.51,21.36 47.52,21.36 46.71,22.18 46.71,27.27 46.04,27.94 v2(45.93,27.94)
  Bottom Layer w0.15: v2(45.93,27.94) 28.08,27.94 14.21,41.8 J2.19
GPIO14: length 49.5
  Top Layer w0.15: v2(46.11,27.08) 46.11,21.51 47.52,20.09 48.51,20.09
  Bottom Layer w0.15: J2.20 25.94,27.08 v2(46.11,27.08)
GPIO15: length 20.9
  Top Layer w0.15: J2.8 43.5,40 49.14,40 57.4,31.73 57.4,30.75
GPIO16: length 22.1
  Top Layer w0.15: 56.13,30.75 56.13,31.73 48.63,39.23 41.73,39.23 J2.9
GPIO17: length 23.4
  Top Layer w0.15: 54.86,30.75 54.86,31.73 48.81,37.79 40.63,37.79 J2.10
GPIO18: length 24.7
  Top Layer w0.15: 53.59,30.75 53.59,31.73 48.55,36.77 39.11,36.77 J2.11
GPIO21: length 31.5
  Top Layer w0.15: J3.15 25.75,4.03 27.58,4.03 32.73,9.19 36.6,9.19 46.24,18.82 48.51,18.82
GPIO38: length 23.4
  Top Layer w0.15: v2(44.72,5.53) 50.76,11.58 54.17,11.58 54.86,12.27 54.86,13.25
  Bottom Layer w0.15: v2(44.72,5.53) 39.95,5.53 J3.10
GPIO39: length 25.6
  Top Layer w0.15: 56.13,13.25 56.13,14.77 v2(54.77,16.13)
  Bottom Layer w0.15: J3.9 41.52,4.56 44.51,4.56 54.77,14.82 v2(54.77,16.13)
GPIO40: length 20.9
  Top Layer w0.15: 57.4,13.25 57.4,12.27 54.56,9.43 49.61,9.43 42.38,2.2 J3.8
GPIO41: length 19.6
  Top Layer w0.15: J3.7 50.24,8.2 54.6,8.2 58.67,12.27 58.67,13.25
GPIO42: length 18.5
  Top Layer w0.15: J3.6 49.85,5.27 53.27,5.27 59.94,11.95 59.94,13.25
GPIO45: length 23.9
  Top Layer w0.15: R7.1 45.57,13.25 ; 45.57,13.25 45.57,13.5 47.08,15.01 48.53,15.01 ; 45.57,13.25 43.97,11.65 43.97,9.65 38.42,4.1 33.44,4.1 J3.12
GPIO46: length 30.2
  Top Layer w0.15: v2(46.75,29.77) 46.75,28.48 47.52,27.71 48.51,27.71 ; R8.1 45.05,33 45.05,32.81 v2(44.7,32.45)
  Bottom Layer w0.15: v2(46.75,29.77) 46.75,30.4 v2(44.7,32.45) 35.81,32.45 J2.14
GPIO47: length 34.4
  Top Layer w0.15: 48.51,17.55 49.49,17.55 49.52,17.52 49.52,14.45 49.31,14.24 49.25,14.24 48,13 v2(48,11.09)
  Bottom Layer w0.15: J3.14 27.49,1.17 34.52,1.17 35.35,2 35.35,2.39 44.05,11.09 v2(48,11.09)
GPIO48: length 26.4
  Top Layer w0.15: 48.51,16.28 47.52,16.28 42.57,11.33 42.57,10.64 ; J3.13 30.53,3.73 31.61,3.73 38.53,10.64 42.57,10.64 ; 42.57,10.64 R9.1
PWR_LED_A: length 3.4
  Top Layer w0.15: LED1.2 34.38,10 34.88,9.5 36.43,9.5 36.43,10
STAT_LED_A: length 3.1
  Top Layer w0.15: LED2.2 41.38,10 41.88,9.5 42.95,9.5 43.43,9.97 43.43,10
U0RXD: length 13.9
  Top Layer w0.15: 61.21,13.25 61.21,11.92 54.4,5.11 J3.3
U0TXD: length 13.3
  Top Layer w0.15: J3.2 56.94,6.49 62.48,12.04 62.48,13.25
USB_DN: length 64.8
  Top Layer w0.15: v2(19.3,24.94) 19.3,20.17 18.13,19 TP8.1 14.87,19 14.87,19.17 12.54,21.5 ; 12.54,21.5 U1.2 ; 12.54,21.5 13.69,22.64 v2(13.69,22.88) ; 9.15,22.98 v2(9.38,22.98) 9.15,22.75 6.79,22.75 6.79,21.75 J1.A7 ; 51.05,30.75 51.05,24.81 v2(51.81,24.05)
  Bottom Layer w0.15: v2(13.69,22.88) 9.47,22.88 v2(9.38,22.98) 9.15,22.98 ; v2(51.81,24.05) 20.19,24.05 v2(19.3,24.94)
USB_DP: length 67.6
  Top Layer w0.15: v2(13.12,18.88) 12.51,19.48 12.51,21 U1.1 ; v2(18.5,22.43) 18.13,22.8 18.13,25 TP7.1 ; 8.55,21.25 8.55,22.25 J1.A6 ; 8.55,21.25 9.09,20.72 v2(9.09,20.43) ; 8.55,21.25 J1.B6 ; v2(50,21.44) 50.34,21.78 50.34,29.21 49.78,29.77 49.78,30.75
  Bottom Layer w0.15: 18.5,22.22 v2(18.5,22.43) ; 18.5,22.22 10.87,22.22 v2(9.09,20.43) 11.57,20.43 v2(13.12,18.88) ; 18.5,22.22 19.28,21.44 v2(50,21.44)

## Copper pours and planes (outline as drawn; the poured copper is in the pictures)
GND on Top Layer: 36.11,23.94 47.52,23.94 47.52,10.22 36.11,10.22
GND on Top Layer: 45.99,14.64 48.31,14.64 48.31,10.12 45.99,10.12
GND on Top Layer: 33.36,40.55 50.81,40.55 50.81,33.98 33.36,33.98
GND on Top Layer: 31.97,10.27 42.91,10.27 42.91,3.45 31.97,3.45
GND on Top Layer: 38.39,12.33 45.7,12.33 45.7,3.61 38.39,3.61
GND on Top Layer: 45.94,33.44 51.73,33.44 51.73,30 45.94,30
GND on Top Layer: 62.94,34.96 65.1,34.96 65.1,32.57 62.94,32.57
GND on Top Layer: 0.5,43.5 66.9,43.5 66.9,0.5 0.5,0.5
GND on Top Layer: 5.54,27.28 9.75,27.28 9.75,24.94 5.54,24.94
GND on Top Layer: 26.81,8.81 36.17,8.81 36.17,2.85 26.81,2.85
GND on Top Layer: 5.54,18.79 8.28,18.79 8.28,16.69 5.54,16.69
GND on Top Layer: 61.35,37.75 66.9,37.75 66.9,32.59 61.35,32.59
GND on Bottom Layer: 23.2,40.55 45.53,40.55 45.53,29.55 23.2,29.55
GND on Bottom Layer: 16.18,41.15 31.8,41.15 31.8,28.31 16.18,28.31
GND on Bottom Layer: 0.5,43.5 66.9,43.5 66.9,0.5 0.5,0.5
GND on Bottom Layer: 14.81,39.11 28.09,39.11 28.09,27.46 14.81,27.46
